# Altium schematic sheet KY.SchDoc: ИЛ1428ТО1/1
size 410 x 297 mm; ApprovedBy: Стерхов В.Д; CheckedBy: Стерхов В.Д; Author: Сергеев Д.А.; CompanyName: ГК "СНАБЖЕНИЕ"; DrawnBy: Сергеев Д.А.; Engineer: Сергеев Д.А.; Organization: ГК "СНАБЖЕНИЕ"; DocumentNumber: ИЛ1428ТО1/1; Revision: 1; SheetNumber: 5; SheetTotal: 5
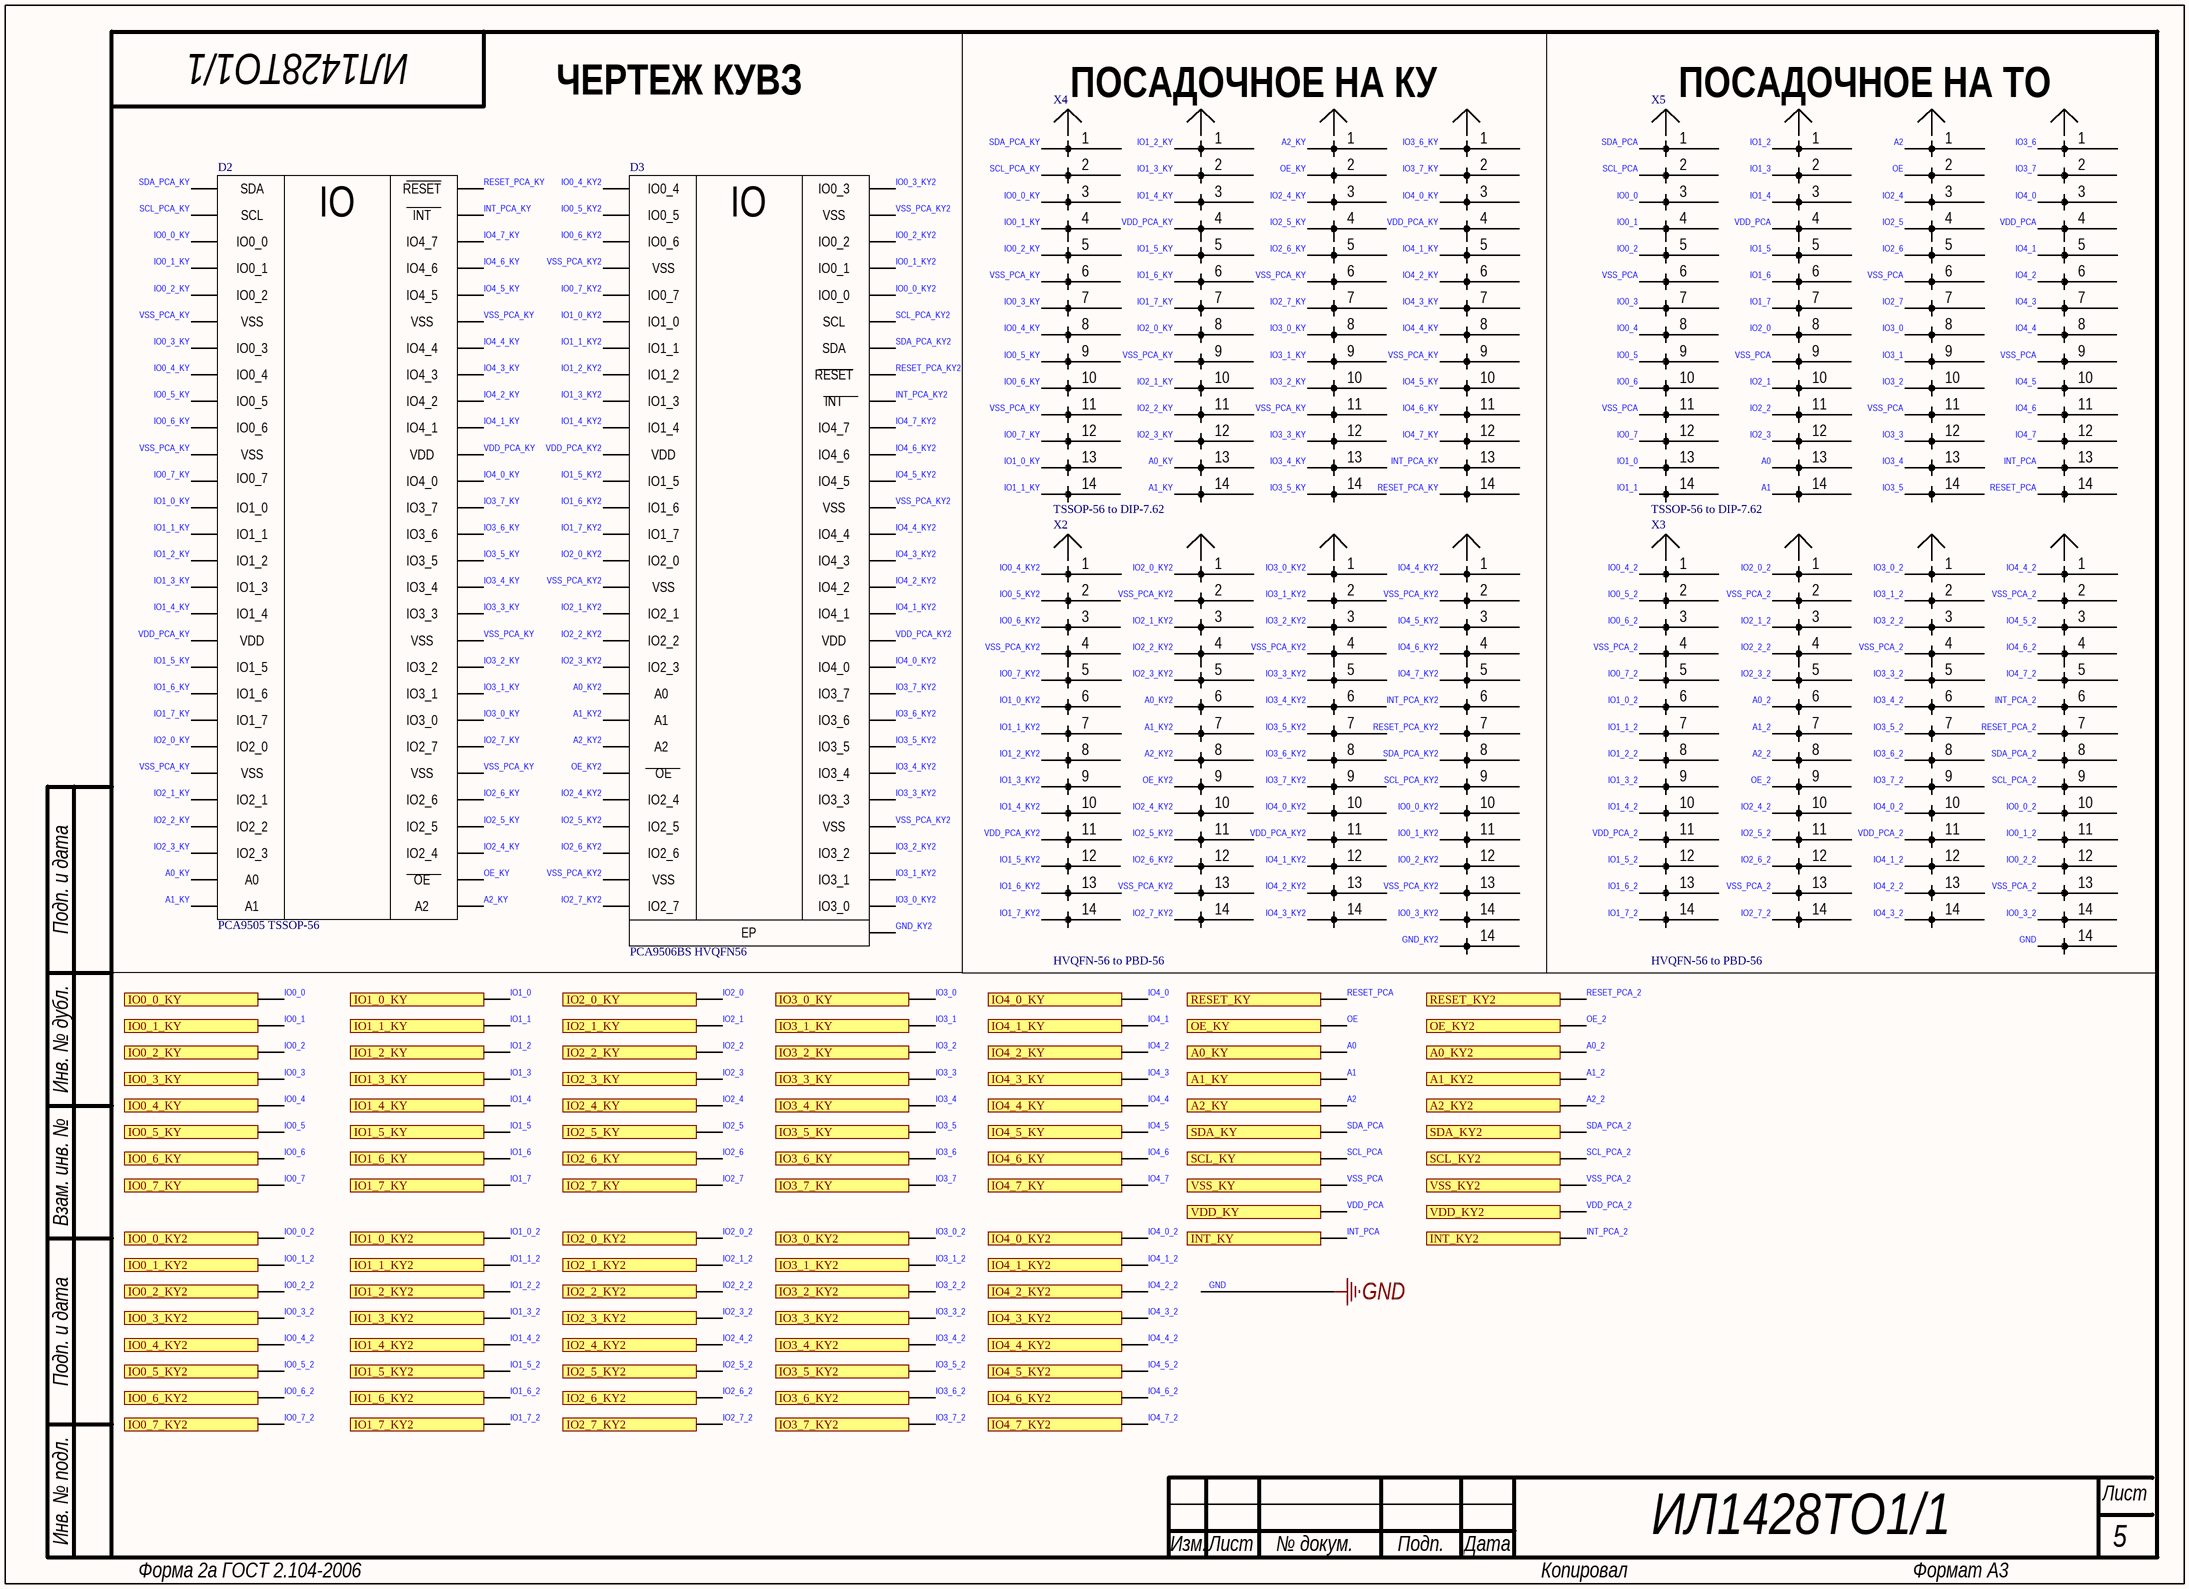
[diagram p0: KY.SchDoc]

## Parts
D2  PCA9505 TSSOP-56  [OTS-56(64)-0.5-02]
D3  PCA9506BS HVQFN56  [56QN50S18080]
X2  HVQFN-56 to PBD-56  [HVQFN-56 to PD-56]
X3  HVQFN-56 to PBD-56  [HVQFN-56 to PD-56]
X4  TSSOP-56 to DIP-7.62  [TSSOP-56 to DIP 7.62]
X5  TSSOP-56 to DIP-7.62  [TSSOP-56 to DIP 7.62]

## Ports
A0_KY, A0_KY2, A1_KY, A1_KY2, A2_KY, A2_KY2, INT_KY, INT_KY2, IO0_0_KY, IO0_0_KY2, IO0_1_KY, IO0_1_KY2, IO0_2_KY, IO0_2_KY2, IO0_3_KY, IO0_3_KY2, IO0_4_KY, IO0_4_KY2, IO0_5_KY, IO0_5_KY2, IO0_6_KY, IO0_6_KY2, IO0_7_KY, IO0_7_KY2, IO1_0_KY, IO1_0_KY2, IO1_1_KY, IO1_1_KY2, IO1_2_KY, IO1_2_KY2, IO1_3_KY, IO1_3_KY2, IO1_4_KY, IO1_4_KY2, IO1_5_KY, IO1_5_KY2, IO1_6_KY, IO1_6_KY2, IO1_7_KY, IO1_7_KY2, IO2_0_KY, IO2_0_KY2, IO2_1_KY, IO2_1_KY2, IO2_2_KY, IO2_2_KY2, IO2_3_KY, IO2_3_KY2, IO2_4_KY, IO2_4_KY2, IO2_5_KY, IO2_5_KY2, IO2_6_KY, IO2_6_KY2, IO2_7_KY, IO2_7_KY2, IO3_0_KY, IO3_0_KY2, IO3_1_KY, IO3_1_KY2, IO3_2_KY, IO3_2_KY2, IO3_3_KY, IO3_3_KY2, IO3_4_KY, IO3_4_KY2, IO3_5_KY, IO3_5_KY2, IO3_6_KY, IO3_6_KY2, IO3_7_KY, IO3_7_KY2, IO4_0_KY, IO4_0_KY2, IO4_1_KY, IO4_1_KY2, IO4_2_KY, IO4_2_KY2, IO4_3_KY, IO4_3_KY2, IO4_4_KY, IO4_4_KY2, IO4_5_KY, IO4_5_KY2, IO4_6_KY, IO4_6_KY2, IO4_7_KY, IO4_7_KY2, OE_KY, OE_KY2, RESET_KY, RESET_KY2, SCL_KY, SCL_KY2, SDA_KY, SDA_KY2, VDD_KY, VDD_KY2, VSS_KY, VSS_KY2

## Nets
GND: X3.57
A0: X5.27 ; port A0_KY
A0_2: X3.20 ; port A0_KY2
A0_KY: D2.27 X4.27
A0_KY2: D3.20 X2.20
A1: X5.28 ; port A1_KY
A1_2: X3.21 ; port A1_KY2
A1_KY: D2.28 X4.28
A1_KY2: D3.21 X2.21
A2: X5.29 ; port A2_KY
A2_2: X3.22 ; port A2_KY2
A2_KY: D2.29 X4.29
A2_KY2: D3.22 X2.22
GND_KY2: D3.57 X2.57
INT_PCA: X5.55 ; port INT_KY
INT_PCA_2: X3.48 ; port INT_KY2
INT_PCA_KY: D2.55 X4.55
INT_PCA_KY2: D3.48 X2.48
IO0_0: X5.3 ; port IO0_0_KY
IO0_0_2: X3.52 ; port IO0_0_KY2
IO0_0_KY: D2.3 X4.3
IO0_0_KY2: D3.52 X2.52
IO0_1: X5.4 ; port IO0_1_KY
IO0_1_2: X3.53 ; port IO0_1_KY2
IO0_1_KY: D2.4 X4.4
IO0_1_KY2: D3.53 X2.53
IO0_2: X5.5 ; port IO0_2_KY
IO0_2_2: X3.54 ; port IO0_2_KY2
IO0_2_KY: D2.5 X4.5
IO0_2_KY2: D3.54 X2.54
IO0_3: X5.7 ; port IO0_3_KY
IO0_3_2: X3.56 ; port IO0_3_KY2
IO0_3_KY: D2.7 X4.7
IO0_3_KY2: D3.56 X2.56
IO0_4: X5.8 ; port IO0_4_KY
IO0_4_2: X3.1 ; port IO0_4_KY2
IO0_4_KY: D2.8 X4.8
IO0_4_KY2: D3.1 X2.1
IO0_5: X5.9 ; port IO0_5_KY
IO0_5_2: X3.2 ; port IO0_5_KY2
IO0_5_KY: D2.9 X4.9
IO0_5_KY2: D3.2 X2.2
IO0_6: X5.10 ; port IO0_6_KY
IO0_6_2: X3.3 ; port IO0_6_KY2
IO0_6_KY: D2.10 X4.10
IO0_6_KY2: D3.3 X2.3
IO0_7: X5.12 ; port IO0_7_KY
IO0_7_2: X3.5 ; port IO0_7_KY2
IO0_7_KY: D2.12 X4.12
IO0_7_KY2: D3.5 X2.5
IO1_0: X5.13 ; port IO1_0_KY
IO1_0_2: X3.6 ; port IO1_0_KY2
IO1_0_KY: D2.13 X4.13
IO1_0_KY2: D3.6 X2.6
IO1_1: X5.14 ; port IO1_1_KY
IO1_1_2: X3.7 ; port IO1_1_KY2
IO1_1_KY: D2.14 X4.14
IO1_1_KY2: D3.7 X2.7
IO1_2: X5.15 ; port IO1_2_KY
IO1_2_2: X3.8 ; port IO1_2_KY2
IO1_2_KY: D2.15 X4.15
IO1_2_KY2: D3.8 X2.8
IO1_3: X5.16 ; port IO1_3_KY
IO1_3_2: X3.9 ; port IO1_3_KY2
IO1_3_KY: D2.16 X4.16
IO1_3_KY2: D3.9 X2.9
IO1_4: X5.17 ; port IO1_4_KY
IO1_4_2: X3.10 ; port IO1_4_KY2
IO1_4_KY: D2.17 X4.17
IO1_4_KY2: D3.10 X2.10
IO1_5: X5.19 ; port IO1_5_KY
IO1_5_2: X3.12 ; port IO1_5_KY2
IO1_5_KY: D2.19 X4.19
IO1_5_KY2: D3.12 X2.12
IO1_6: X5.20 ; port IO1_6_KY
IO1_6_2: X3.13 ; port IO1_6_KY2
IO1_6_KY: D2.20 X4.20
IO1_6_KY2: D3.13 X2.13
IO1_7: X5.21 ; port IO1_7_KY
IO1_7_2: X3.14 ; port IO1_7_KY2
IO1_7_KY: D2.21 X4.21
IO1_7_KY2: D3.14 X2.14
IO2_0: X5.22 ; port IO2_0_KY
IO2_0_2: X3.15 ; port IO2_0_KY2
IO2_0_KY: D2.22 X4.22
IO2_0_KY2: D3.15 X2.15
IO2_1: X5.24 ; port IO2_1_KY
IO2_1_2: X3.17 ; port IO2_1_KY2
IO2_1_KY: D2.24 X4.24
IO2_1_KY2: D3.17 X2.17
IO2_2: X5.25 ; port IO2_2_KY
IO2_2_2: X3.18 ; port IO2_2_KY2
IO2_2_KY: D2.25 X4.25
IO2_2_KY2: D3.18 X2.18
IO2_3: X5.26 ; port IO2_3_KY
IO2_3_2: X3.19 ; port IO2_3_KY2
IO2_3_KY: D2.26 X4.26
IO2_3_KY2: D3.19 X2.19
IO2_4: X5.31 ; port IO2_4_KY
IO2_4_2: X3.24 ; port IO2_4_KY2
IO2_4_KY: D2.31 X4.31
IO2_4_KY2: D3.24 X2.24
IO2_5: X5.32 ; port IO2_5_KY
IO2_5_2: X3.25 ; port IO2_5_KY2
IO2_5_KY: D2.32 X4.32
IO2_5_KY2: D3.25 X2.25
IO2_6: X5.33 ; port IO2_6_KY
IO2_6_2: X3.26 ; port IO2_6_KY2
IO2_6_KY: D2.33 X4.33
IO2_6_KY2: D3.26 X2.26
IO2_7: X5.35 ; port IO2_7_KY
IO2_7_2: X3.28 ; port IO2_7_KY2
IO2_7_KY: D2.35 X4.35
IO2_7_KY2: D3.28 X2.28
IO3_0: X5.36 ; port IO3_0_KY
IO3_0_2: X3.29 ; port IO3_0_KY2
IO3_0_KY: D2.36 X4.36
IO3_0_KY2: D3.29 X2.29
IO3_1: X5.37 ; port IO3_1_KY
IO3_1_2: X3.30 ; port IO3_1_KY2
IO3_1_KY: D2.37 X4.37
IO3_1_KY2: D3.30 X2.30
IO3_2: X5.38 ; port IO3_2_KY
IO3_2_2: X3.31 ; port IO3_2_KY2
IO3_2_KY: D2.38 X4.38
IO3_2_KY2: D3.31 X2.31
IO3_3: X5.40 ; port IO3_3_KY
IO3_3_2: X3.33 ; port IO3_3_KY2
IO3_3_KY: D2.40 X4.40
IO3_3_KY2: D3.33 X2.33
IO3_4: X5.41 ; port IO3_4_KY
IO3_4_2: X3.34 ; port IO3_4_KY2
IO3_4_KY: D2.41 X4.41
IO3_4_KY2: D3.34 X2.34
IO3_5: X5.42 ; port IO3_5_KY
IO3_5_2: X3.35 ; port IO3_5_KY2
IO3_5_KY: D2.42 X4.42
IO3_5_KY2: D3.35 X2.35
IO3_6: X5.43 ; port IO3_6_KY
IO3_6_2: X3.36 ; port IO3_6_KY2
IO3_6_KY: D2.43 X4.43
IO3_6_KY2: D3.36 X2.36
IO3_7: X5.44 ; port IO3_7_KY
IO3_7_2: X3.37 ; port IO3_7_KY2
IO3_7_KY: D2.44 X4.44
IO3_7_KY2: D3.37 X2.37
IO4_0: X5.45 ; port IO4_0_KY
IO4_0_2: X3.38 ; port IO4_0_KY2
IO4_0_KY: D2.45 X4.45
IO4_0_KY2: D3.38 X2.38
IO4_1: X5.47 ; port IO4_1_KY
IO4_1_2: X3.40 ; port IO4_1_KY2
IO4_1_KY: D2.47 X4.47
IO4_1_KY2: D3.40 X2.40
IO4_2: X5.48 ; port IO4_2_KY
IO4_2_2: X3.41 ; port IO4_2_KY2
IO4_2_KY: D2.48 X4.48
IO4_2_KY2: D3.41 X2.41
IO4_3: X5.49 ; port IO4_3_KY
IO4_3_2: X3.42 ; port IO4_3_KY2
IO4_3_KY: D2.49 X4.49
IO4_3_KY2: D3.42 X2.42
IO4_4: X5.50 ; port IO4_4_KY
IO4_4_2: X3.43 ; port IO4_4_KY2
IO4_4_KY: D2.50 X4.50
IO4_4_KY2: D3.43 X2.43
IO4_5: X5.52 ; port IO4_5_KY
IO4_5_2: X3.45 ; port IO4_5_KY2
IO4_5_KY: D2.52 X4.52
IO4_5_KY2: D3.45 X2.45
IO4_6: X5.53 ; port IO4_6_KY
IO4_6_2: X3.46 ; port IO4_6_KY2
IO4_6_KY: D2.53 X4.53
IO4_6_KY2: D3.46 X2.46
IO4_7: X5.54 ; port IO4_7_KY
IO4_7_2: X3.47 ; port IO4_7_KY2
IO4_7_KY: D2.54 X4.54
IO4_7_KY2: D3.47 X2.47
OE: X5.30 ; port OE_KY
OE_2: X3.23 ; port OE_KY2
OE_KY: D2.30 X4.30
OE_KY2: D3.23 X2.23
RESET_PCA: X5.56 ; port RESET_KY
RESET_PCA_2: X3.49 ; port RESET_KY2
RESET_PCA_KY: D2.56 X4.56
RESET_PCA_KY2: D3.49 X2.49
SCL_PCA: X5.2 ; port SCL_KY
SCL_PCA_2: X3.51 ; port SCL_KY2
SCL_PCA_KY: D2.2 X4.2
SCL_PCA_KY2: D3.51 X2.51
SDA_PCA: X5.1 ; port SDA_KY
SDA_PCA_2: X3.50 ; port SDA_KY2
SDA_PCA_KY: D2.1 X4.1
SDA_PCA_KY2: D3.50 X2.50
VDD_PCA: X5.18 X5.46 ; port VDD_KY
VDD_PCA_2: X3.11 X3.39 ; port VDD_KY2
VDD_PCA_KY: D2.18 D2.46 X4.18 X4.46
VDD_PCA_KY2: D3.11 D3.39 X2.11 X2.39
VSS_PCA: X5.6 X5.11 X5.23 X5.34 X5.39 X5.51 ; port VSS_KY
VSS_PCA_2: X3.4 X3.16 X3.27 X3.32 X3.44 X3.55 ; port VSS_KY2
VSS_PCA_KY: D2.6 D2.11 D2.23 D2.34 D2.39 D2.51 X4.6 X4.11 X4.23 X4.34 X4.39 X4.51
VSS_PCA_KY2: D3.4 D3.16 D3.27 D3.32 D3.44 D3.55 X2.4 X2.16 X2.27 X2.32 X2.44 X2.55

## Notes on the sheet
- ЧЕРТЕЖ КУВЗ
- (near X4) ПОСАДОЧНОЕ НА КУ
- (near X5) ПОСАДОЧНОЕ НА ТО
- Подп. и дата
- Инв. № дубл.
- Взам. инв. №
- Инв. № подл.
- Изм.
- Лист
- № докум.
- Подп.
- Дата
- Форма 2а ГОСТ 2.104-2006
- Копировал
- Формат А3
- (in symbol PCA9505DGG & PCA9506DGG) SDA; RESET; IO; SCL; INT; IO0_0; IO4_7; IO0_1; IO4_6; IO0_2; IO4_5; VSS; IO0_3; IO4_4; IO0_4; IO4_3; IO0_5; IO4_2; IO0_6; IO4_1; VDD; IO0_7; IO4_0; IO1_0; IO3_7; IO1_1; IO3_6; IO1_2; IO3_5; IO1_3; IO3_4; IO1_4; IO3_3; IO1_5; IO3_2; IO1_6; IO3_1; IO1_7; IO3_0; IO2_0; IO2_7; IO2_1; IO2_6; IO2_2; IO2_5; IO2_3; IO2_4; A0; OE; A1; A2
- (in symbol PCA9506BS) IO0_4; IO0_3; IO; IO0_5; VSS; IO0_6; IO0_2; IO0_1; IO0_7; IO0_0; IO1_0; SCL; IO1_1; SDA; IO1_2; RESET; IO1_3; INT; IO1_4; IO4_7; VDD; IO4_6; IO1_5; IO4_5; IO1_6; IO1_7; IO4_4; IO2_0; IO4_3; IO4_2; IO2_1; IO4_1; IO2_2; IO2_3; IO4_0; A0; IO3_7; A1; IO3_6; A2; IO3_5; OE; IO3_4; IO2_4; IO3_3; IO2_5; IO2_6; IO3_2; IO3_1; IO2_7; IO3_0; EP

## Library data of the parts
D2 = PCA9505DGG & PCA9506DGG
D3 = PCA9506BS